# Altium schematic sheet PIR_V1.SchDoc
size 177 x 127 mm; SheetNumber: 1; SheetTotal: 1
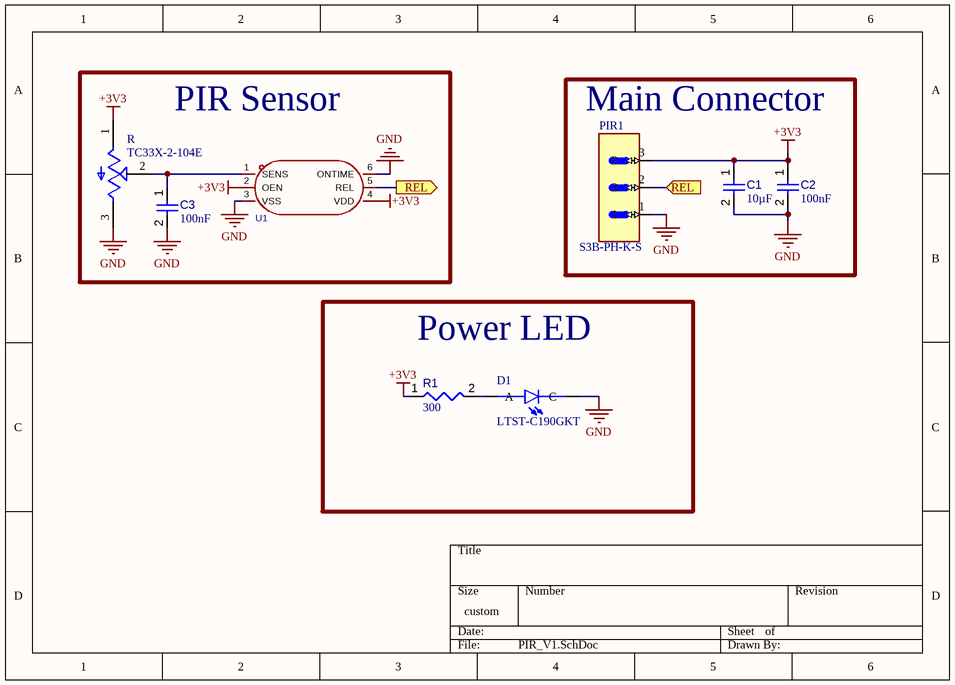
[diagram p0: PIR_V1.SchDoc]

## Parts
C1  value 10µF  [CAPC0402(1005)60_L]  (hidden comment: Capacitor 10µF +/-40% 6.3V 0402)
C2  value 100nF  [CAPC1005X56X25LL10T15]  (hidden comment: Capacitor 0.1 uF +/- 5% 16 V 0402)
C3  value 100nF  [CAPC1005X56X25LL10T15]  (hidden comment: Capacitor 0.1 uF +/- 5% 16 V 0402)
D1  LTST-C190GKT  [LEDM1608X80]
PIR1  S3B-PH-K-S  [S3B-PH-K-S]
R  TC33X-2-104E  [TRIM_TC33X-2-104E]
R1  value 300  [RESC0402(1005)_L]  (hidden comment: 240R2J)
U1  BS612  [SENSORM-TH_BS612]  (value not drawn)

## Blocks framed on the sheet
PIR Sensor: C3 R U1
Main Connector: C1 C2 PIR1
Power LED: D1 R1

## Ports
REL (in), REL (out)

## Nets
+3V3: C1.1 C2.1 PIR1.3 R.1(CCW) R1.1 U1.2(OEN) U1.4(VDD)
GND: C1.2 C2.2 C3.2 D1.C PIR1.1 R.3(CW) U1.3(VSS) U1.6(ONTIME)
REL: PIR1.2 U1.5(REL) ; port REL
NetC3_1: C3.1 R.2(W) U1.1(SENS)
NetD1_A: D1.A R1.2

## Library data of the parts
C1 = CMP-001-00074-3: Chip Capacitor, 10µF +/-40%, 6.3V, 0402, Thickness 0.6 mm; Tolerance: 10%; Case/Package: 0402; Pins: 2; Mounting Technology: SMT; Voltage Rating: 6.3V; Max Operating Temperature: 85°C; Min Operating Temperature: -55°C
C2 C3 = CMP-001-00001-6: Chip Capacitor, 0.1 uF, +/- 5%, 16 V, 0402 (1005 Metric); Capacitor Type: Ceramic; Voltage Rating: 16V; Max Operating Temperature: 125°C; Min Operating Temperature: -55°C; Case/Package: 0402; Mounting Technology: SM; Pins: 2; Tolerance: 5%; RoHS Compliant: True
D1 = LTST-C190GKT: MF: {'manufacturer': u'Lite-On Inc.'}; Package: None; Price: None; Value: *; MP: LTST-C190GKT; Availability: Unavailable
PIR1 = S3B-PH-K-S: Connector Header Through Hole, Right Angle 3 position 0.079 (2.00mm); MF: JST Sales; SnapEDA_Link: https://www.snapeda.com/parts/S3B-PH-K-S/JST/view-part/?ref=snap; Package: NON STANDARD-3 J.S.T.; Value: *; MP: S3B-PH-K-S; Check_prices: https://www.snapeda.com/parts/S3B-PH-K-S/JST/view-part/?ref=eda
R = TC33X-2-104E: 100 kOhms 0.1W, 1/10W J Lead Surface Mount Trimmer Potentiometer Cermet 1 Turn Top Adjustment; MF: Bourns; Package: SOD-23 Bourns; Availability: Unavailable; MP: TC33X-2-104E; Value: *; SnapEDA_Link: https://www.snapeda.com/parts/TC33X-2-104E/Bourns/view-part/50727/?ref=snap; Price: None
R1 = CMP-009-00084-2: 240R 0.063W 5% 0402 (1005 Metric)  SMD; Power: 63mW; Pins: 2; Case/Package: 0402; Mounting Technology: SMT; Tolerance: 5%
U1 = BS612: Window Shape:Rectangle Voltage - Supply:2.2V~3.7V Voltage - Supply:2.2V~3.7V Current - Supply:9.5uA Operating Temperature:-20℃~+85℃ Operating Temperature:-20℃~+85℃ Features:-; Manufacturer: 森霸; AddInBom: yes; ModelId: 09a3d265544b411fb2cc04346c41faa3ÂŽ0819f05c4eef4c71ace90d822a990e87; ModelTransform: 387.7945,358.17739,0,0,0,0,13.78,0.001,-196.85; Current - Supply: 9.5uA; Symbol: BS612; Device: BS612; LCSC Part Name: 数字智能热释电红外传感器; SupplierPart: C389589; ManufacturerPart: BS612; Supplier Footprint: 插件; JLCPCB Part Class: Extended Part; Datasheet: https://item.szlcsc.com/datasheet/BS612/365441.html; Supplier: LCSC; ConvertToPcb: yes; FootprintName: SENSORM-TH_BS612; ModelName: SENSORM-TH_BS612; Window Shape: Rectangle; Voltage - Supply: 2.2V~3.7V; Operating Temperature: -20℃~+85℃; Features: -